# Altium project Bento Pad Mini-v1.0.PrjPcb (part 2 of 2)

## Sheet Button Sheet.SchDoc
size A4; SheetNumber: 3; SheetTotal: 3
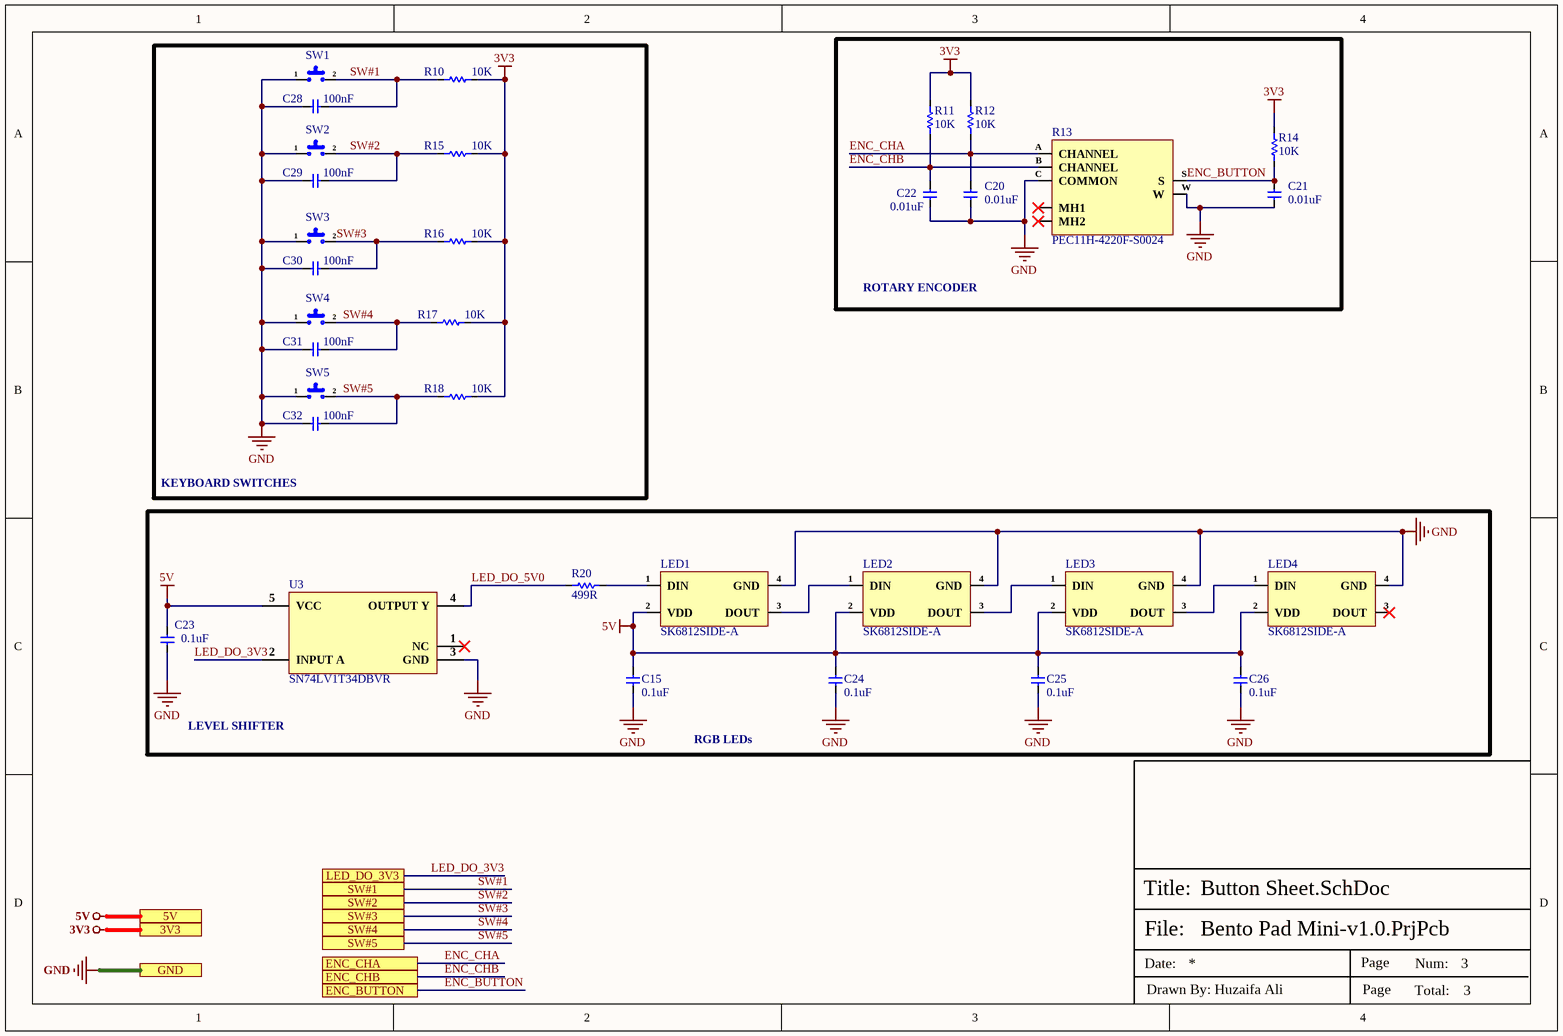
[diagram p2: Button Sheet.SchDoc]

### Parts
C15  0.1uF  [Cap-0402]
C20  0.01uF  [Cap-0402]
C21  0.01uF  [Cap-0402]
C22  0.01uF  [Cap-0402]
C23  0.1uF  [Cap-0402]
C24  0.1uF  [Cap-0402]
C25  0.1uF  [Cap-0402]
C26  0.1uF  [Cap-0402]
C28  100nF  [cap-0402]
C29  100nF  [cap-0402]
C30  100nF  [cap-0402]
C31  100nF  [cap-0402]
C32  100nF  [cap-0402]
LED1  SK6812SIDE-A  [SK6812SIDE-A]
LED2  SK6812SIDE-A  [SK6812SIDE-A]
LED3  SK6812SIDE-A  [SK6812SIDE-A]
LED4  SK6812SIDE-A  [SK6812SIDE-A]
R10  10K  [Res-0402]
R11  10K  [Res-0402]
R12  10K  [Res-0402]
R13  PEC11H-4220F-S0024  [PEC11H-4220F-S0024]
R14  10K  [Res-0402]
R15  10K  [Res-0402]
R16  10K  [Res-0402]
R17  10K  [Res-0402]
R18  10K  [Res-0402]
R20  499R  [Res-0603]
SW1  CPG151101S11-16  [CPG151101S11-16]  (value not drawn)
SW2  CPG151101S11-16  [CPG151101S11-16]  (value not drawn)
SW3  CPG151101S11-16  [CPG151101S11-16]  (value not drawn)
SW4  CPG151101S11-16  [CPG151101S11-16]  (value not drawn)
SW5  CPG151101S11-16  [CPG151101S11-16]  (value not drawn)
U3  SN74LV1T34DBVR  [SOT-23-5]

### Blocks framed on the sheet
KEYBOARD SWITCHES: C28-C32 R10 R15-R18 SW1-SW5
ROTARY ENCODER: C20-C22 R11-R14

### Ports
3V3, 5V, ENC_BUTTON, ENC_CHA, ENC_CHB, GND, LED_DO_3V3, SW#1, SW#2, SW#3, SW#4, SW#5

### Nets
3V3: R10.1 R11.2 R12.2 R14.2 R15.1 R16.1 R17.1 R18.1 ; port 3V3
5V: C15.2 C23.2 C24.2 C25.2 C26.2 LED1.2(VDD) LED2.2(VDD) LED3.2(VDD) LED4.2(VDD) U3.5(VCC) ; port 5V
GND: C15.1 C20.1 C21.1 C22.1 C23.1 C24.1 C25.1 C26.1 C28.1 C29.1 C30.1 C31.1 C32.1 LED1.4(GND) LED2.4(GND) LED3.4(GND) LED4.4(GND) R13.C(COMMON) R13.W SW1.1 SW2.1 SW3.1 SW4.1 SW5.1 U3.3(GND) ; port GND
ENC_BUTTON: C21.2 R13.S R14.1 ; port ENC_BUTTON
ENC_CHA: C20.2 R12.1 R13.A(CHANNEL) ; port ENC_CHA
ENC_CHB: C22.2 R11.1 R13.B(CHANNEL) ; port ENC_CHB
LED_DO_3V3: U3.2(INPUT_A) ; port LED_DO_3V3
LED_DO_5V0: R20.1 U3.4(OUTPUT_Y)
SW#1: C28.2 R10.2 SW1.2 ; port SW#1
SW#2: C29.2 R15.2 SW2.2 ; port SW#2
SW#3: C30.2 R16.2 SW3.2 ; port SW#3
SW#4: C31.2 R17.2 SW4.2 ; port SW#4
SW#5: C32.2 R18.2 SW5.2 ; port SW#5
NetLED1_1: LED1.1(DIN) R20.2
NetLED1_3: LED1.3(DOUT) LED2.1(DIN)
NetLED2_3: LED2.3(DOUT) LED3.1(DIN)
NetLED3_3: LED3.3(DOUT) LED4.1(DIN)

Not connected (* = marked no-connect by the designer): LED4 3(DOUT)*; R13 MH1* MH2*; U3 1(NC)*

### Notes on the sheet
- LEVEL SHIFTER
- RGB LEDs
- File:
- Title:
- Date:
- Page
- Num:
- Total:
- Drawn By: Huzaifa Ali

### Library data of the parts
C15 C23-C26 = GRM155R71E104KE14D: CAP CER 0.1UF 25V X7R 0402; Manufacturer: Murata; Item Type: Capacitors; Dielectric Material: Ceramic; Material: 4241ConductorMaterial; Value: 100nF; Tolerance: 10%; Supplier: Mouser; LCSC Part Number: C77014; Manufacturer Part Number: GRM155R71E104KE14D; RoHS: Yes; Stock: 652368; Pricing: 1=0.1, 10=0.007, 50=0.007, 100=0.005, 1000=0.005, 10000=0.004 (USD); Mounting Technology: Surface Mount; Case/Package: 0402; Pins: 2NUMBER; Case Code (Metric): 1005; Case Code (Imperial): 0402; Weight: 0.000212oz; Min Operating Temperature: -55°C; Max Operating Temperature: 125°C; Packaging: Tape and Reel; Voltage Rating: 25V; Dielectric: X7R; Voltage: 25V; Termination: SMD/SMT; Voltage Rating (DC): 25V; Package Quantity: 10000; Series: GRM; Length: 1mm; Width: 0.02inch; Height: 0.5mm; Thickness: 0.022inch; Depth: 0.5mm; RoHS Compliant: Yes; Reach SVHC Compliant: Unknown; Lead Free: 5697LeadFree; ComponentLink1URL: http://www.farnell.com/datasheets/1872206.pdf?src-supplier=Farnell; ComponentLink1Description: http://www.farnell.com/datasheets/1872206.pdf?src-supplier=Farnell; ComponentLink2URL: http://www.mouser.com/ds/2/281/c02e-2905.pdf?src-supplier=Mouser; ComponentLink2Description: http://www.mouser.com/ds/2/281/c02e-2905.pdf?src-supplier=Mouser; ComponentLink3URL: http://uk.rs-online.com/webdocs/144c/0900766b8144c113.pdf?src-supplier=Rs; ComponentLink3Description: http://uk.rs-online.com/webdocs/144c/0900766b8144c113.pdf?src-supplier=Rs; ComponentLink4URL: https://datasheet.octopart.com/GRM155R71E104KE14D-Murata-datasheet-62346597.pdf?src-supplier=Future+Electronics; ComponentLink4Description: https://datasheet.octopart.com/GRM155R71E104KE14D-Murata-datasheet-62346597.pdf?src-supplier=Future+Electronics; ComponentLink5URL: https://search.murata.co.jp/Ceramy/image/img/A01X/G101/ENG/GRM155R71E104KE14-01.pdf?src-supplier=Digikey; ComponentLink5Description: https://search.murata.co.jp/Ceramy/image/img/A01X/G101/ENG/GRM155R71E104KE14-01.pdf?src-supplier=Digikey; ComponentLink6URL: http://www.farnell.com/datasheets/2048008.pdf?src-supplier=Newark; ComponentLink6Description: http://www.farnell.com/datasheets/2048008.pdf?src-supplier=Newark; ComponentLink7URL: https://datasheet.octopart.com/GRM155R71E104KE14D-Murata-datasheet-62317124.pdf?src-supplier=Element14; ComponentLink7Description: https://datasheet.octopart.com/GRM155R71E104KE14D-Murata-datasheet-62317124.pdf?src-supplier=Element14; ComponentLink8URL: http://psearch.en.murata.com/capacitor/product/GRM155R71E104KE14%23.pdf?src-supplier=Avnet; ComponentLink8Description: http://psearch.en.murata.com/capacitor/product/GRM155R71E104KE14%23.pdf?src-supplier=Avnet
C20-C22 = CC0402KRX5R8BB103: CAP CER 10000PF 25V X5R 0402; Manufacturer: Yageo; Item Type: Capacitor; Supplier 1: Future Electronics; Manufacturer Part Number: CC0402KRX5R8BB103; RoHS: Yes; Category: Ceramic Capacitors; Stock 1: 140000; Pricing 1: 10000=0.00290, 40000=0.00270, 150000=0.00260, 250000=0.00250, 500000=0.00240 (USD); RoHS Compliant: Yes; Supplier Part Number 1: 2101932; LCSC Part Number: C576726; ComponentLink1Description: LCSC; ComponentLink1URL: https://www.lcsc.com/product-detail/Multilayer-Ceramic-Capacitors-MLCC-SMD-SMT_YAGEO-CC0402KRX5R8BB103_C576726.html
C28-C32 = C1005X7R1H104KT000F: CAP CER 0.1UF 50V X7R 0402; Manufacturer: TDK; Tolerance: 10%; Voltage: 25V; Item Type: Capacitor; Supplier 1: Avnet; Manufacturer Part Number: C1005X7R1H104KT000F; RoHS: No; Category: Ceramic Capacitors; Dielectric: X7R; Supplier Part Number 1: C1005X7R1H104KT000F; LCSC Part Number: C361198; ComponentLink1Description: LCSC; ComponentLink1URL: https://www.lcsc.com/product-detail/Multilayer-Ceramic-Capacitors-MLCC-SMD-SMT_TDK-C1005X7R1H104KT000F_C361198.html
LED1-LED4 = SK6812SIDE-A: SMD-4P,1.6x4mm Light Emitting Diodes (LED) ROHS; Manufacturer: OPSCO Optoelectronics; Item type: Addressable RGB LED; ComponentLink1Description: LCSC; ComponentLink1URL: https://www.lcsc.com/product-detail/Light-Emitting-Diodes-LED_OPSCO-Optoelectronics-SK6812SIDE-A_C5378721.html; Manufacturer Part Number: SK6812SIDE-A; Package: SMD-4P,1.6x4mm; LCSC Part Number: C5378721
R10-R12 R14-R18 = RC0402FR-0710KL: RES 10K OHM 1% 1/16W 0402; Manufacturer: Yageo; Resistance: 10kR; Voltage Rating (DC): 50V; Temperature Coefficient: 100ppm/°C; Power Rating: 62.5mW; Max Power Dissipation: 63mW; Item Type: Resistor; Supplier 1: Mouser; Manufacturer Part Number: RC0402FR-0710KL; RoHS: Yes; Category: Chip SMD Resistors; Stock 1: 18648329; Pricing 1: 1=0.10000, 10=0.01400, 50=0.01400, 100=0.00500, 1000=0.00300, 10000=0.00200 (USD); Case/Package: 0402; Number of Pins: 2; Case Code (Imperial): 0402; Case Code (Metric): 1005; Min Operating Temperature: -55°C; Max Operating Temperature: 155°C; Resistor Type: Thick Film; Tolerance: 1%; Packaging: Tape and Reel; Voltage Rating: 50V; Termination: SMD/SMT; Working Voltage: 50V; Number of Terminations: 2; Features: Moisture Resistant; Series: RC; Resistance Tolerance: 1%; Construction: Rectangular; Length: 1mm; Width: 0.5mm; Height: 0.32mm; Depth: 0.5mm; Lead Pitch: 0.2mm; REACH SVHC: No SVHC; Lead Free: Lead Free; RoHS Compliant: Yes; Military Standard: Not; ComponentLink1URL: https://datasheet.ciiva.com/7660/38568-7660787.pdf?src-supplier=Element14; ComponentLink1Description: https://datasheet.ciiva.com/7660/38568-7660787.pdf?src-supplier=Element14; ComponentLink2URL: https://datasheet.ciiva.com/7849/1686128-7849814.pdf?src-supplier=Element14; ComponentLink2Description: https://datasheet.ciiva.com/7849/1686128-7849814.pdf?src-supplier=Element14; ComponentLink3URL: https://datasheet.ciiva.com/7983/1018594-7983486.pdf?src-supplier=Element14; ComponentLink3Description: https://datasheet.ciiva.com/7983/1018594-7983486.pdf?src-supplier=Element14; ComponentLink4URL: https://datasheet.ciiva.com/22747/1018594-22747512.pdf?src-supplier=Element14; ComponentLink4Description: https://datasheet.ciiva.com/22747/1018594-22747512.pdf?src-supplier=Element14; ComponentLink5URL: https://datasheet.ciiva.com/12667/pyu-rc0402-51-rohs-l-6-r-12667067.pdf?src-supplier=Mouser; ComponentLink5Description: https://datasheet.ciiva.com/12667/pyu-rc0402-51-rohs-l-6-r-12667067.pdf?src-supplier=Mouser; ComponentLink6URL: https://datasheet.ciiva.com/7849/1784430-7849813.pdf?src-supplier=Element14; ComponentLink6Description: https://datasheet.ciiva.com/7849/1784430-7849813.pdf?src-supplier=Element14; ComponentLink7URL: https://datasheet.ciiva.com/7849/1784430-7849815.pdf?src-supplier=Element14; ComponentLink7Description: https://datasheet.ciiva.com/7849/1784430-7849815.pdf?src-supplier=Element14; Supplier Part Number 1: 603-RC0402FR-0710KL; LCSC Part Number: C60490
R13 = PEC11H-4220F-S0024: 11mm Encoder with 24 Detent Force 20mm Metal Flatted Shaft PC Pin Horizontal/Rear Facing; Manufacturer: Bourns; Supplier: Digikey; Supplier Part Number: 118-PEC11H-4220F-S0024-ND; Manufacturer Part Number: PEC11H-4220F-S0024; RoHS: No; Stock: 1001; Pricing: 1=3.04, 5=2.746, 10=2.565, 25=2.3516, 75=2.194, 150=2.0646, 300=1.89023, 450=1.77209, 975=1.65958 (USD); Item Type: Encoder; Package: Custom; LCSC Part Number: -; ComponentLink1Description: Digikey; ComponentLink1URL: https://www.digikey.com/en/products/detail/bourns-inc/PEC11H-4220F-S0024/12349532
R20 = RC0603FR-07499RL: RES 499 OHM 1% 1/10W 0603; Manufacturer: Yageo; Temperature Coefficient: 100ppm/°C; Power Rating: 100mW; Voltage Rating: 50V; Supplier 1: RSComponents; Manufacturer Part Number: RC0603FR-07499RL; RoHS: Yes; Category: Chip SMD Resistors; Stock 1: 900; Pricing 1: 5000=0.00300, 10000=0.00300, 15000=0.00300, 20000=0.00200 (GBP); Mount: Surface Mount; Case/Package: 0603; Contact Plating: Tin,Matte; Case Code (Metric): 1608; Case Code (Imperial): 0603; Size Code: 0603; Min Operating Temperature: -55°C; Max Operating Temperature: 155°C; Resistance: 499R; Tolerance: 1%; Resistor Type: Thick Film; Package Quantity: 1; Packaging: Tape and Reel; Number of Terminations: 2; Termination: SMD/SMT; Max Power Dissipation: 100mW; Voltage Rating (DC): 50V; Features: Moisture Resistant; Series: RC; Construction: Rectangular; Technology: THICK FILM; Length: 1.6mm; Width: 0.031inch; Height: 0.45mm; Depth: 0.8mm; Radiation Hardening: No; Military Standard: Not; Lead Free: Lead Free; RoHS Compliant: Yes; ComponentLink1URL: https://datasheet.ciiva.com/11808/0900766b80f96399-11808558.pdf?src-supplier=RSComponents; ComponentLink1Description: https://datasheet.ciiva.com/11808/0900766b80f96399-11808558.pdf?src-supplier=RSComponents; ComponentLink2URL: https://datasheet.ciiva.com/2453/pyu-r-int-thick-7-2453956.pdf?src-supplier=Digi-Key; ComponentLink2Description: https://datasheet.ciiva.com/2453/pyu-r-int-thick-7-2453956.pdf?src-supplier=Digi-Key; ComponentLink3URL: https://datasheet.ciiva.com/2453/pyu-r-int-thick-7-2453957.pdf?src-supplier=Digi-Key; ComponentLink3Description: https://datasheet.ciiva.com/2453/pyu-r-int-thick-7-2453957.pdf?src-supplier=Digi-Key; ComponentLink4URL: https://datasheet.ciiva.com/2453/pyu-r-int-thick-7-2453955.pdf?src-supplier=Digi-Key; ComponentLink4Description: https://datasheet.ciiva.com/2453/pyu-r-int-thick-7-2453955.pdf?src-supplier=Digi-Key; ComponentLink5URL: https://datasheet.ciiva.com/12558/rc0603-272842-12558391.pdf?src-supplier=Mouser; ComponentLink5Description: https://datasheet.ciiva.com/12558/rc0603-272842-12558391.pdf?src-supplier=Mouser; ComponentLink6URL: https://datasheet.ciiva.com/8885/pyu-rc0603-51-rohs-l-4-8885483.pdf?src-supplier=Avnet; ComponentLink6Description: https://datasheet.ciiva.com/8885/pyu-rc0603-51-rohs-l-4-8885483.pdf?src-supplier=Avnet; Supplier Part Number 1: 1995585; LCSC Part Number: C137714
SW1-SW5 = CPG151101S11-16: SMD,14.5x5.9mm Mechanical Keyboard Shaft ROHS; Manufacturer: HanElectricity; Manufacturer Part Number: CPG151101S11-16; Package: SMD,14.5x5.9mm; LCSC Part Number: C41430893; Item Type: Mechanical Keyboard Shaft; ComponentLink1Description: LCSC; ComponentLink1URL: https://www.lcsc.com/product-detail/Mechanical-Keyboard-Shaft_HanElectricity-CPG151101S11-16_C41430893.html?s_z=n_%2520CPG151101S11-16
U3 = SN74LV1T34DBVR: IC BUF NON-INVERT 5.5V SOT23-5; Manufacturer: Texas Instruments; Number of Elements: 1; Logic Function: Buffer,Inverting; High Level Output Current: -8mA; Low Level Output Current: 8mA; Min Supply Voltage: 1.6V; Polarity: Non-Inverting; Propagation Delay: 15.5ns; Quiescent Current: 1uA; Supplier 1: Digi-Key; Manufacturer Part Number: SN74LV1T34DBVR; Stock 1: 37360; Pricing 1: 1=0.43, 10=0.349, 25=0.3192, 100=0.2374, 250=0.2152, 500=0.17808, 1000=0.13356 (USD); Mount: Surface Mount; Case/Package: SOT-23-5; Number of Pins: 5; Weight: 0.000353oz; Min Operating Temperature: -40°C; Max Operating Temperature: 125°C; Packaging: Tape and Reel; Number of Bits per Element: 1; Number of Bits: 1; Package Quantity: 3000; Max Supply Voltage: 5.5V; Number of Input Lines: 1; Number of Output Lines: 1; Operating Supply Current: 8mA; Number of Channels: 1; Number of Inputs: 1; Number of Outputs: 1; Radiation Hardening: No; RoHS Compliant: Yes; REACH SVHC: No SVHC; Lead Free: Lead Free; ComponentLink1URL: http://www.ti.com/lit/pdf/sdyu001?src-supplier=Digi-Key; ComponentLink1Description: http://www.ti.com/lit/pdf/sdyu001?src-supplier=Digi-Key; ComponentLink2URL: http://www.ti.com/lit/ds/symlink/sn74lv1t34.pdf?src-supplier=Avnet; ComponentLink2Description: http://www.ti.com/lit/ds/symlink/sn74lv1t34.pdf?src-supplier=Avnet; Supplier Part Number 1: 296-37176-6-ND; LCSC Part Number: C100024; Item Type: IC

## Nets that join several sheets
3V3: Power_Sheet (C1.2 U1.4), Controller_Sheet (18 pins), Button Sheet (8 pins)
5V: Power_Sheet (6 pins), Controller_Sheet (5V.1), Button Sheet (10 pins)
GND: Power_Sheet (18 pins), Controller_Sheet (21 pins), Button Sheet (25 pins)
ENC_BUTTON: Controller_Sheet (U2.14), Button Sheet (C21.2 R13.S R14.1)
ENC_CHA: Controller_Sheet (U2.15), Button Sheet (C20.2 R12.1 R13.A)
ENC_CHB: Controller_Sheet (U2.16), Button Sheet (C22.2 R11.1 R13.B)
LED_DO_3V3: Controller_Sheet (U2.50), Button Sheet (U3.2)
SW#1: Controller_Sheet (U2.26), Button Sheet (C28.2 R10.2 SW1.2)
SW#2: Controller_Sheet (U2.22), Button Sheet (C29.2 R15.2 SW2.2)
SW#3: Controller_Sheet (U2.25), Button Sheet (C30.2 R16.2 SW3.2)
SW#4: Controller_Sheet (U2.24), Button Sheet (C31.2 R17.2 SW4.2)
SW#5: Controller_Sheet (U2.23), Button Sheet (C32.2 R18.2 SW5.2)
USB_D_N: Power_Sheet (R1.2), Controller_Sheet (U2.44)
USB_D_P: Power_Sheet (R2.2), Controller_Sheet (U2.45)